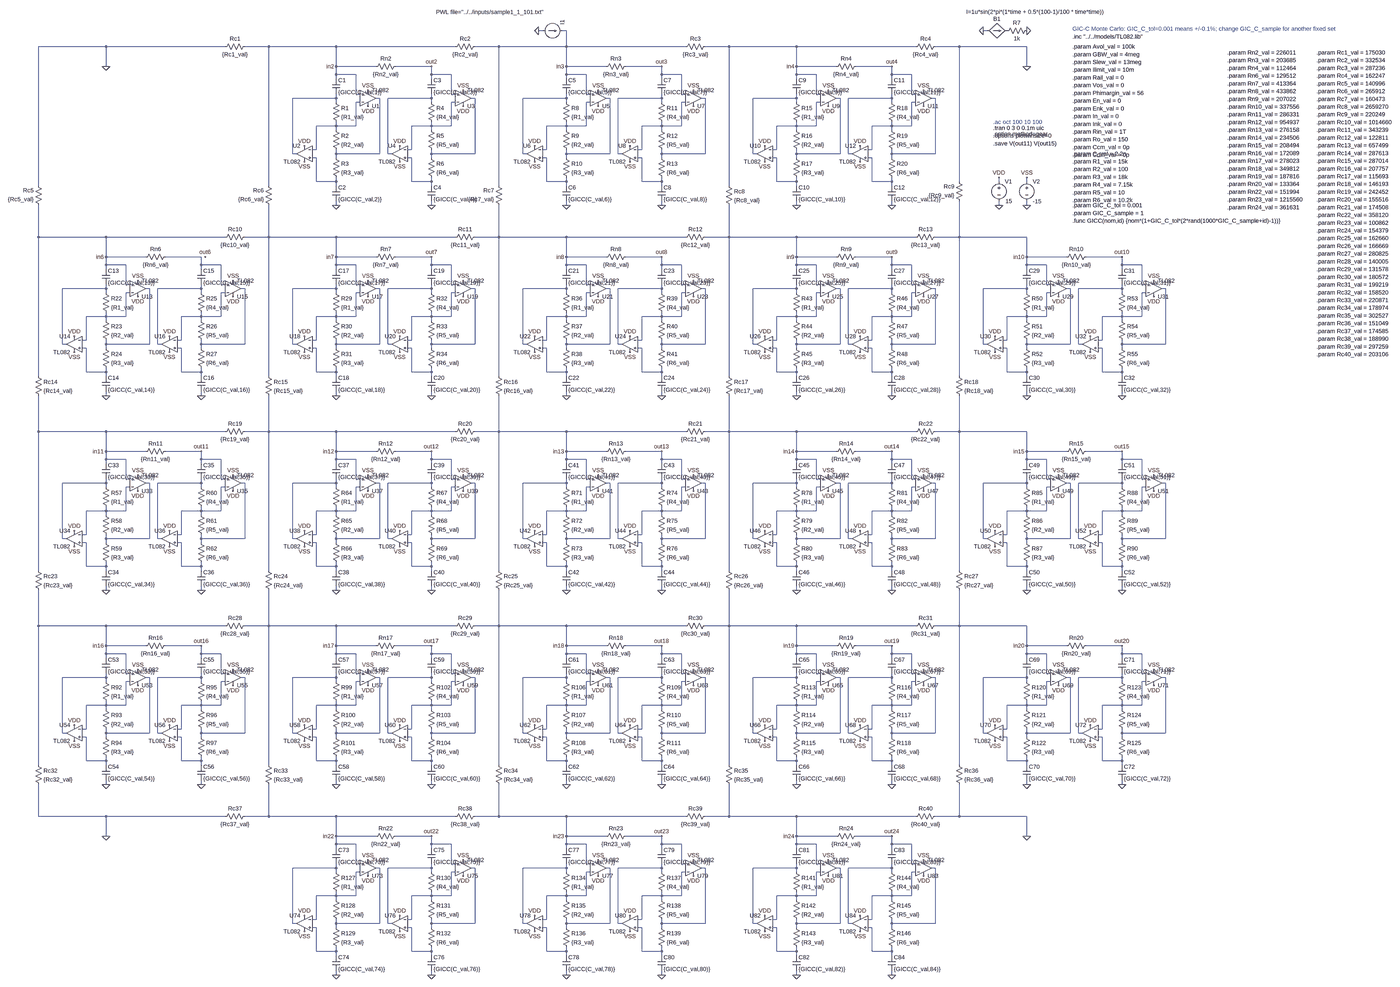
[diagram p0: schematic GIC_C.asc, whole sheet]
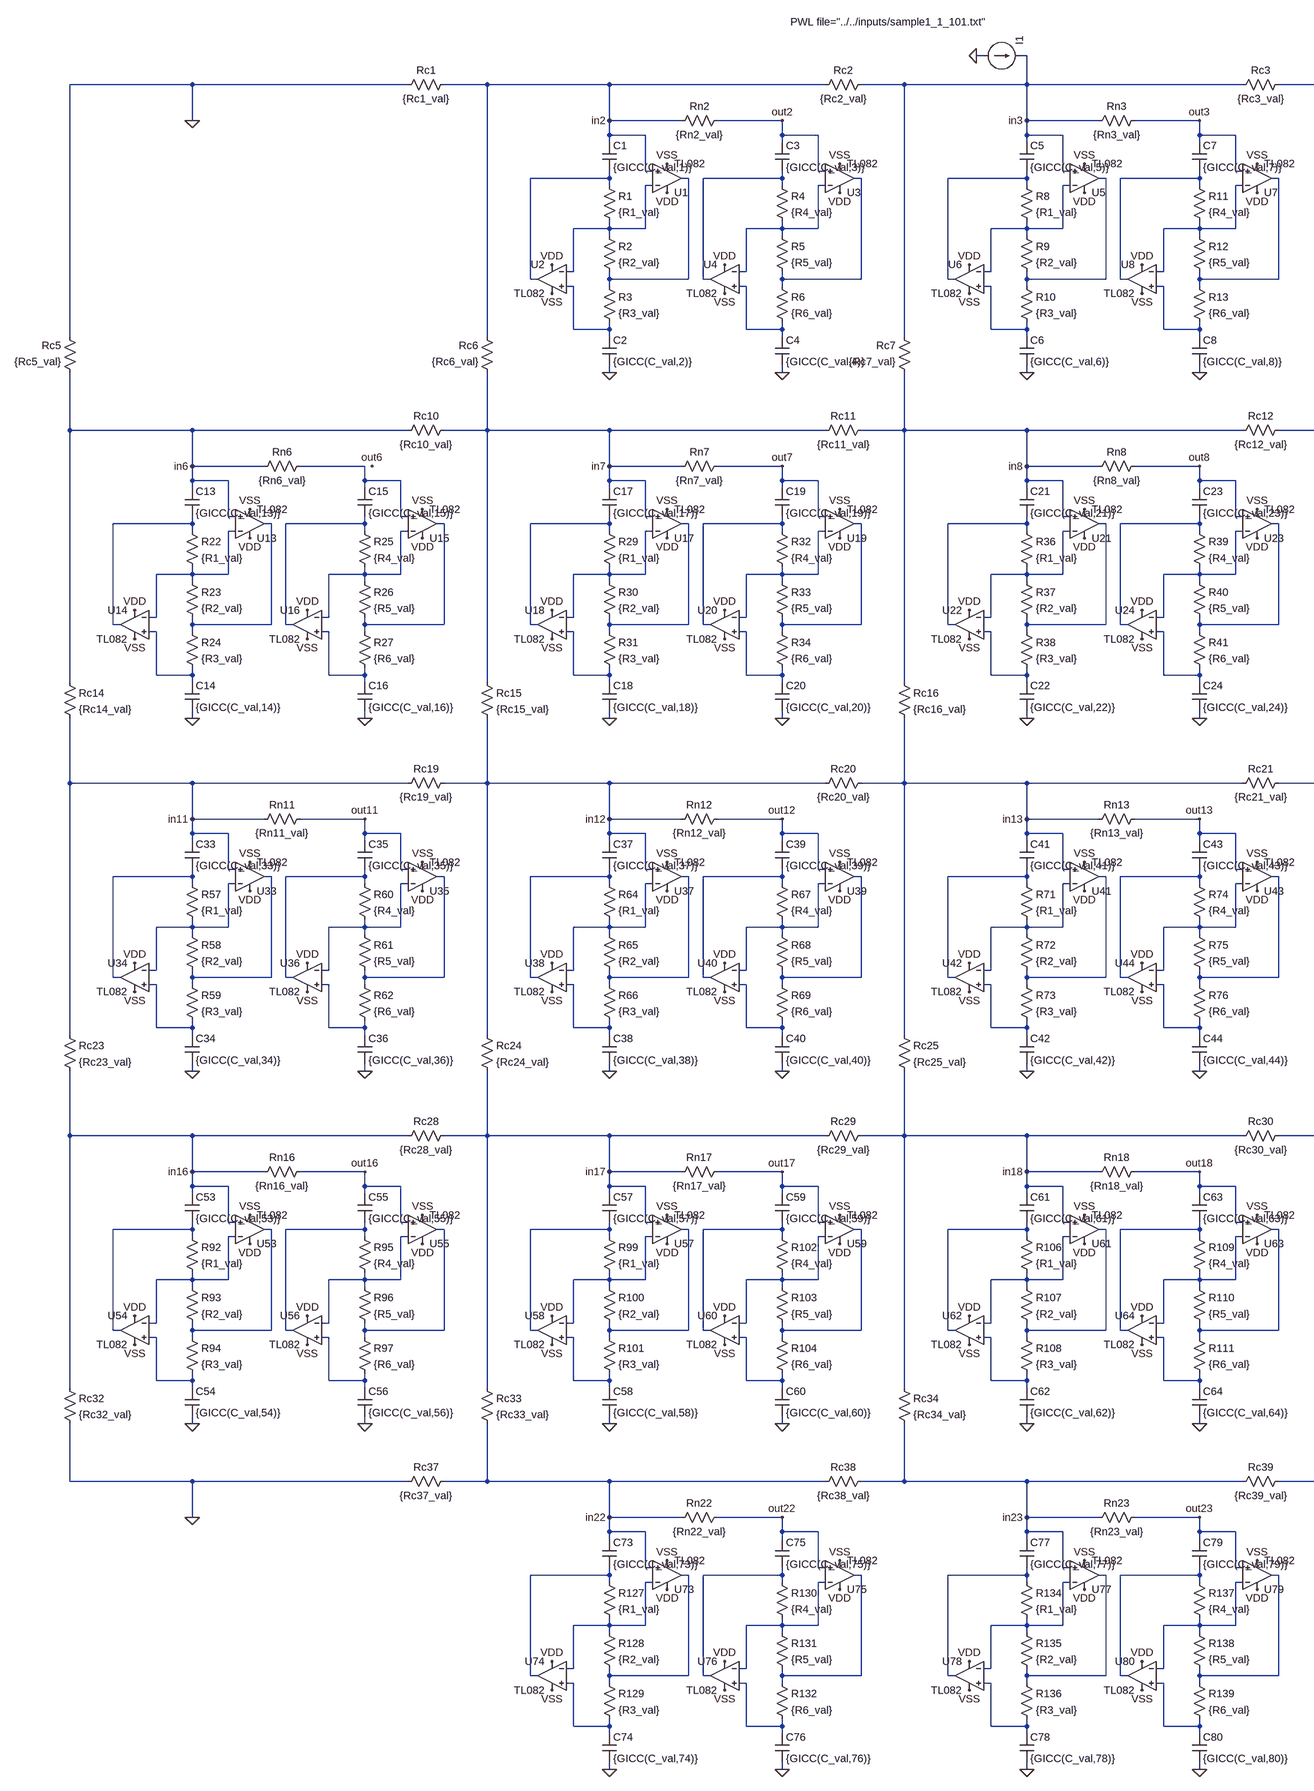
[diagram p1: schematic GIC_C.asc, part, row 1 of 1, column 1 of 2]
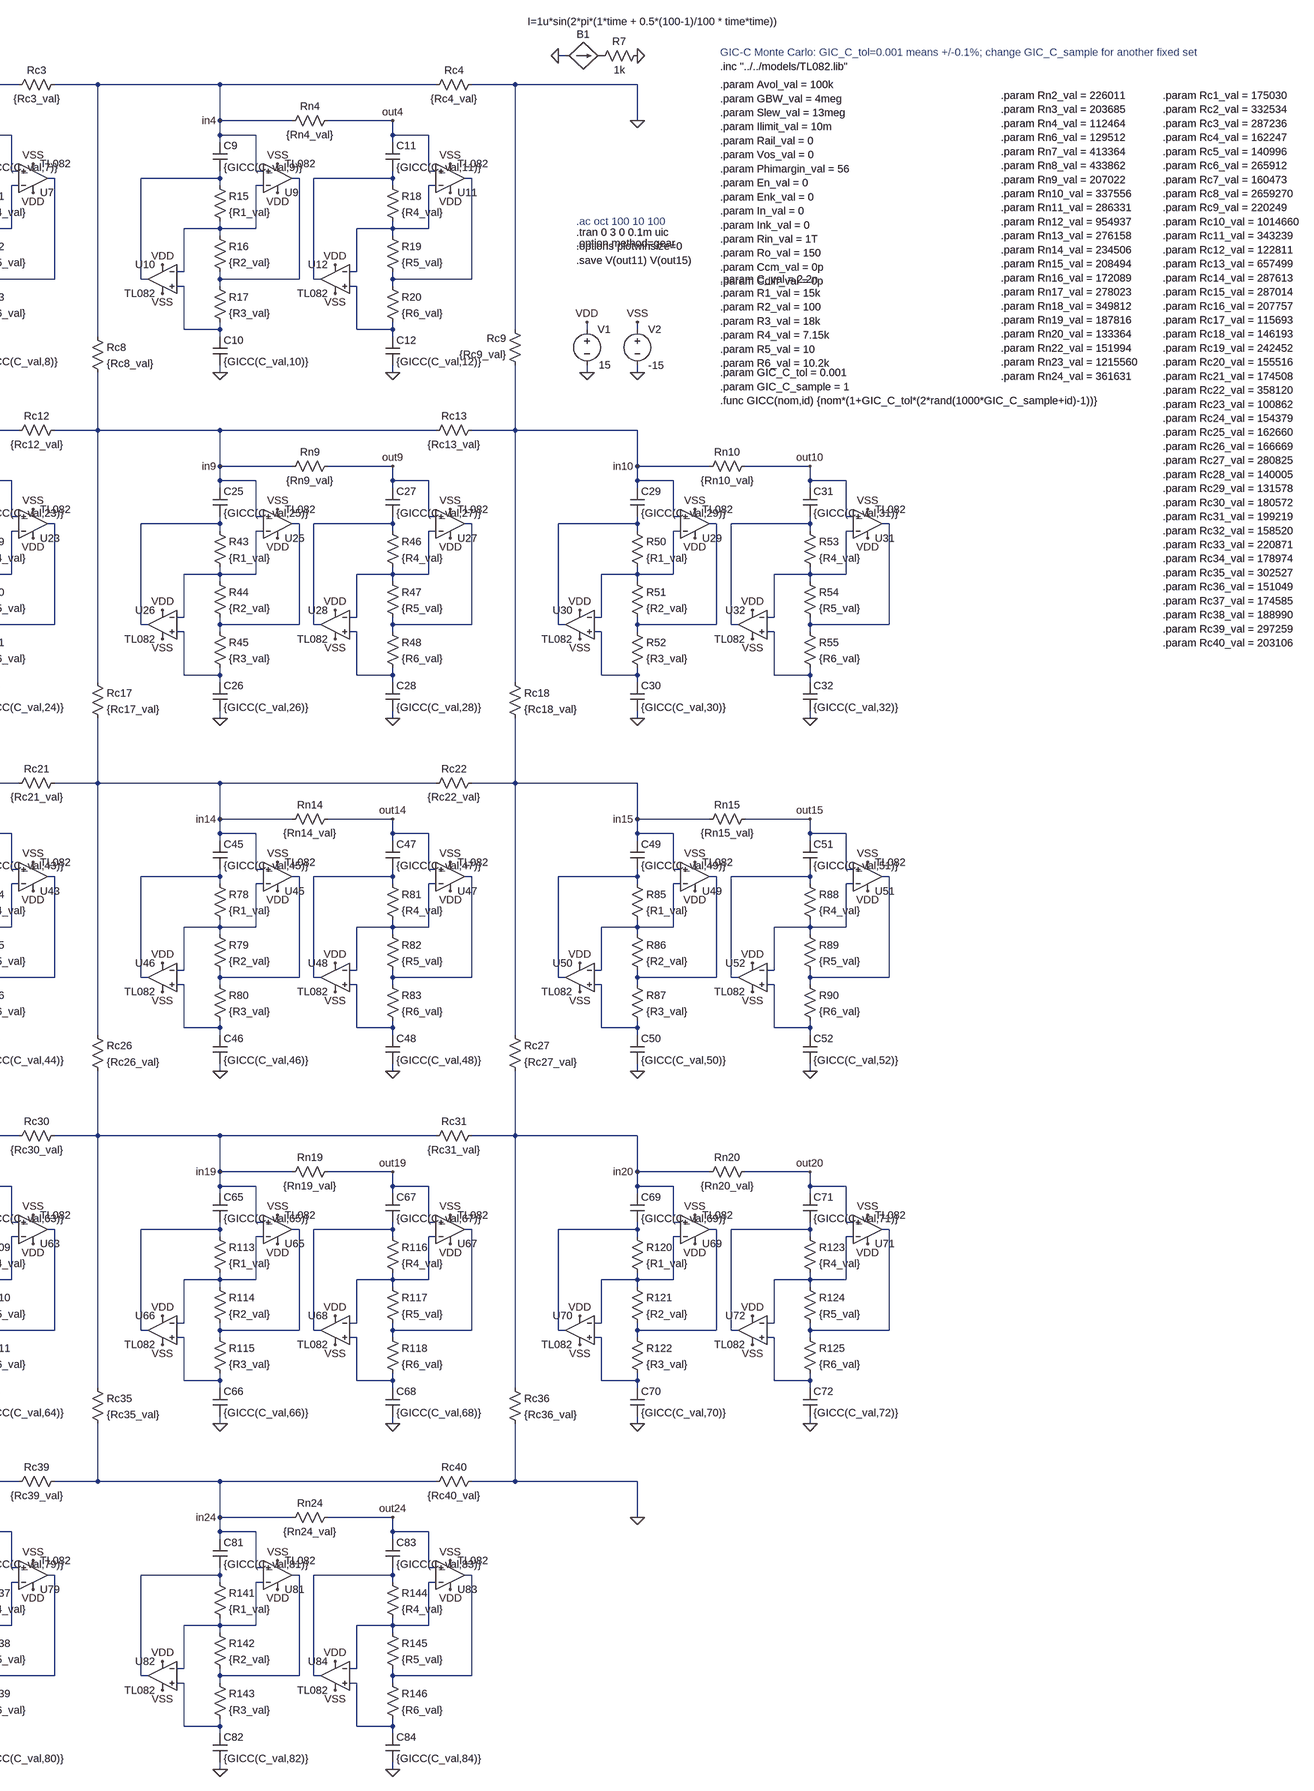
[diagram p2: schematic GIC_C.asc, part, row 1 of 1, column 2 of 2]
* GIC_C.asc
V1 VDD 0 15
V2 VSS 0 -15
C1 in2 N001 {GICC(C_val,1)}
R1 N001 N013 {R1_val}
R2 N013 N002 {R2_val}
R3 N002 N019 {R3_val}
C2 N019 0 {GICC(C_val,2)}
C3 out2 N003 {GICC(C_val,3)}
R4 N003 N014 {R4_val}
R5 N014 N004 {R5_val}
R6 N004 N020 {R6_val}
C4 N020 0 {GICC(C_val,4)}
Rn2 out2 in2 {Rn2_val}
C5 in3 N005 {GICC(C_val,5)}
R8 N005 N015 {R1_val}
R9 N015 N006 {R2_val}
R10 N006 N021 {R3_val}
C6 N021 0 {GICC(C_val,6)}
C7 out3 N007 {GICC(C_val,7)}
R11 N007 N016 {R4_val}
R12 N016 N008 {R5_val}
R13 N008 N022 {R6_val}
C8 N022 0 {GICC(C_val,8)}
Rn3 out3 in3 {Rn3_val}
C9 in4 N009 {GICC(C_val,9)}
R15 N009 N017 {R1_val}
R16 N017 N010 {R2_val}
R17 N010 N023 {R3_val}
C10 N023 0 {GICC(C_val,10)}
C11 out4 N011 {GICC(C_val,11)}
R18 N011 N018 {R4_val}
R19 N018 N012 {R5_val}
R20 N012 N024 {R6_val}
C12 N024 0 {GICC(C_val,12)}
Rn4 out4 in4 {Rn4_val}
C13 in6 N026 {GICC(C_val,13)}
R22 N026 N046 {R1_val}
R23 N046 N027 {R2_val}
R24 N027 N056 {R3_val}
C14 N056 0 {GICC(C_val,14)}
C15 N025 N028 {GICC(C_val,15)}
R25 N028 N047 {R4_val}
R26 N047 N029 {R5_val}
R27 N029 N057 {R6_val}
C16 N057 0 {GICC(C_val,16)}
Rn6 N025 in6 {Rn6_val}
C17 in7 N030 {GICC(C_val,17)}
R29 N030 N048 {R1_val}
R30 N048 N031 {R2_val}
R31 N031 N058 {R3_val}
C18 N058 0 {GICC(C_val,18)}
C19 out7 N032 {GICC(C_val,19)}
R32 N032 N049 {R4_val}
R33 N049 N033 {R5_val}
R34 N033 N059 {R6_val}
C20 N059 0 {GICC(C_val,20)}
Rn7 out7 in7 {Rn7_val}
C21 in8 N034 {GICC(C_val,21)}
R36 N034 N050 {R1_val}
R37 N050 N035 {R2_val}
R38 N035 N060 {R3_val}
C22 N060 0 {GICC(C_val,22)}
C23 out8 N036 {GICC(C_val,23)}
R39 N036 N051 {R4_val}
R40 N051 N037 {R5_val}
R41 N037 N061 {R6_val}
C24 N061 0 {GICC(C_val,24)}
Rn8 out8 in8 {Rn8_val}
C25 in9 N038 {GICC(C_val,25)}
R43 N038 N052 {R1_val}
R44 N052 N039 {R2_val}
R45 N039 N062 {R3_val}
C26 N062 0 {GICC(C_val,26)}
C27 out9 N040 {GICC(C_val,27)}
R46 N040 N053 {R4_val}
R47 N053 N041 {R5_val}
R48 N041 N063 {R6_val}
C28 N063 0 {GICC(C_val,28)}
Rn9 out9 in9 {Rn9_val}
C29 in10 N042 {GICC(C_val,29)}
R50 N042 N054 {R1_val}
R51 N054 N043 {R2_val}
R52 N043 N064 {R3_val}
C30 N064 0 {GICC(C_val,30)}
C31 out10 N044 {GICC(C_val,31)}
R53 N044 N055 {R4_val}
R54 N055 N045 {R5_val}
R55 N045 N065 {R6_val}
C32 N065 0 {GICC(C_val,32)}
Rn10 out10 in10 {Rn10_val}
C33 in11 N066 {GICC(C_val,33)}
R57 N066 N086 {R1_val}
R58 N086 N067 {R2_val}
R59 N067 N096 {R3_val}
C34 N096 0 {GICC(C_val,34)}
C35 out11 N068 {GICC(C_val,35)}
R60 N068 N087 {R4_val}
R61 N087 N069 {R5_val}
R62 N069 N097 {R6_val}
C36 N097 0 {GICC(C_val,36)}
Rn11 out11 in11 {Rn11_val}
C37 in12 N070 {GICC(C_val,37)}
R64 N070 N088 {R1_val}
R65 N088 N071 {R2_val}
R66 N071 N098 {R3_val}
C38 N098 0 {GICC(C_val,38)}
C39 out12 N072 {GICC(C_val,39)}
R67 N072 N089 {R4_val}
R68 N089 N073 {R5_val}
R69 N073 N099 {R6_val}
C40 N099 0 {GICC(C_val,40)}
Rn12 out12 in12 {Rn12_val}
C41 in13 N074 {GICC(C_val,41)}
R71 N074 N090 {R1_val}
R72 N090 N075 {R2_val}
R73 N075 N100 {R3_val}
C42 N100 0 {GICC(C_val,42)}
C43 out13 N076 {GICC(C_val,43)}
R74 N076 N091 {R4_val}
R75 N091 N077 {R5_val}
R76 N077 N101 {R6_val}
C44 N101 0 {GICC(C_val,44)}
Rn13 out13 in13 {Rn13_val}
C45 in14 N078 {GICC(C_val,45)}
R78 N078 N092 {R1_val}
R79 N092 N079 {R2_val}
R80 N079 N102 {R3_val}
C46 N102 0 {GICC(C_val,46)}
C47 out14 N080 {GICC(C_val,47)}
R81 N080 N093 {R4_val}
R82 N093 N081 {R5_val}
R83 N081 N103 {R6_val}
C48 N103 0 {GICC(C_val,48)}
Rn14 out14 in14 {Rn14_val}
C49 in15 N082 {GICC(C_val,49)}
R85 N082 N094 {R1_val}
R86 N094 N083 {R2_val}
R87 N083 N104 {R3_val}
C50 N104 0 {GICC(C_val,50)}
C51 out15 N084 {GICC(C_val,51)}
R88 N084 N095 {R4_val}
R89 N095 N085 {R5_val}
R90 N085 N105 {R6_val}
C52 N105 0 {GICC(C_val,52)}
Rn15 out15 in15 {Rn15_val}
C53 in16 N106 {GICC(C_val,53)}
R92 N106 N126 {R1_val}
R93 N126 N107 {R2_val}
R94 N107 N136 {R3_val}
C54 N136 0 {GICC(C_val,54)}
C55 out16 N108 {GICC(C_val,55)}
R95 N108 N127 {R4_val}
R96 N127 N109 {R5_val}
R97 N109 N137 {R6_val}
C56 N137 0 {GICC(C_val,56)}
Rn16 out16 in16 {Rn16_val}
C57 in17 N110 {GICC(C_val,57)}
R99 N110 N128 {R1_val}
R100 N128 N111 {R2_val}
R101 N111 N138 {R3_val}
C58 N138 0 {GICC(C_val,58)}
C59 out17 N112 {GICC(C_val,59)}
R102 N112 N129 {R4_val}
R103 N129 N113 {R5_val}
R104 N113 N139 {R6_val}
C60 N139 0 {GICC(C_val,60)}
Rn17 out17 in17 {Rn17_val}
C61 in18 N114 {GICC(C_val,61)}
R106 N114 N130 {R1_val}
R107 N130 N115 {R2_val}
R108 N115 N140 {R3_val}
C62 N140 0 {GICC(C_val,62)}
C63 out18 N116 {GICC(C_val,63)}
R109 N116 N131 {R4_val}
R110 N131 N117 {R5_val}
R111 N117 N141 {R6_val}
C64 N141 0 {GICC(C_val,64)}
Rn18 out18 in18 {Rn18_val}
C65 in19 N118 {GICC(C_val,65)}
R113 N118 N132 {R1_val}
R114 N132 N119 {R2_val}
R115 N119 N142 {R3_val}
C66 N142 0 {GICC(C_val,66)}
C67 out19 N120 {GICC(C_val,67)}
R116 N120 N133 {R4_val}
R117 N133 N121 {R5_val}
R118 N121 N143 {R6_val}
C68 N143 0 {GICC(C_val,68)}
Rn19 out19 in19 {Rn19_val}
C69 in20 N122 {GICC(C_val,69)}
R120 N122 N134 {R1_val}
R121 N134 N123 {R2_val}
R122 N123 N144 {R3_val}
C70 N144 0 {GICC(C_val,70)}
C71 out20 N124 {GICC(C_val,71)}
R123 N124 N135 {R4_val}
R124 N135 N125 {R5_val}
R125 N125 N145 {R6_val}
C72 N145 0 {GICC(C_val,72)}
Rn20 out20 in20 {Rn20_val}
C73 in22 N146 {GICC(C_val,73)}
R127 N146 N158 {R1_val}
R128 N158 N147 {R2_val}
R129 N147 N164 {R3_val}
C74 N164 0 {GICC(C_val,74)}
C75 out22 N148 {GICC(C_val,75)}
R130 N148 N159 {R4_val}
R131 N159 N149 {R5_val}
R132 N149 N165 {R6_val}
C76 N165 0 {GICC(C_val,76)}
Rn22 out22 in22 {Rn22_val}
C77 in23 N150 {GICC(C_val,77)}
R134 N150 N160 {R1_val}
R135 N160 N151 {R2_val}
R136 N151 N166 {R3_val}
C78 N166 0 {GICC(C_val,78)}
C79 out23 N152 {GICC(C_val,79)}
R137 N152 N161 {R4_val}
R138 N161 N153 {R5_val}
R139 N153 N167 {R6_val}
C80 N167 0 {GICC(C_val,80)}
Rn23 out23 in23 {Rn23_val}
C81 in24 N154 {GICC(C_val,81)}
R141 N154 N162 {R1_val}
R142 N162 N155 {R2_val}
R143 N155 N168 {R3_val}
C82 N168 0 {GICC(C_val,82)}
C83 out24 N156 {GICC(C_val,83)}
R144 N156 N163 {R4_val}
R145 N163 N157 {R5_val}
R146 N157 N169 {R6_val}
C84 N169 0 {GICC(C_val,84)}
Rn24 out24 in24 {Rn24_val}
Rc2 in3 in2 {Rc2_val}
Rc3 in4 in3 {Rc3_val}
Rc6 in7 in2 {Rc6_val}
Rc7 in8 in3 {Rc7_val}
Rc11 in7 in8 {Rc11_val}
Rc12 in8 in9 {Rc12_val}
Rc13 in9 in10 {Rc13_val}
Rc14 in6 in11 {Rc14_val}
Rc15 in7 in12 {Rc15_val}
Rc16 in8 in13 {Rc16_val}
Rc18 in10 in15 {Rc18_val}
Rc21 in14 in13 {Rc21_val}
Rc22 in15 in14 {Rc22_val}
Rc23 in11 in16 {Rc23_val}
Rc24 in12 in17 {Rc24_val}
Rc25 in13 in18 {Rc25_val}
Rc26 in14 in19 {Rc26_val}
Rc27 in15 in20 {Rc27_val}
Rc28 in17 in16 {Rc28_val}
Rc30 in19 in18 {Rc30_val}
Rc32 in16 0 {Rc32_val}
Rc33 in17 in22 {Rc33_val}
Rc34 in18 in23 {Rc34_val}
Rc35 in19 in24 {Rc35_val}
Rc36 in20 0 {Rc36_val}
Rc1 in2 0 {Rc1_val}
Rc5 in6 0 {Rc5_val}
Rc9 in10 0 {Rc9_val}
Rc4 in4 0 {Rc4_val}
Rc37 in22 0 {Rc37_val}
Rc38 in23 in22 {Rc38_val}
Rc39 in24 in23 {Rc39_val}
Rc40 0 in24 {Rc40_val}
R7 0 P001 1k
B1 0 P001 I=1u*sin(2*pi*(1*time + 0.5*(100-1)/100 * time*time))
I1 0 in3 PWL file="../../inputs/sample1_1_101.txt"
X§U1 in2 N013 VDD VSS N002 TL082  ; pins In+ In- V+ V- OUT
X§U2 N019 N013 VDD VSS N001 TL082  ; pins In+ In- V+ V- OUT
X§U3 out2 N014 VDD VSS N004 TL082  ; pins In+ In- V+ V- OUT
X§U4 N020 N014 VDD VSS N003 TL082  ; pins In+ In- V+ V- OUT
X§U5 in3 N015 VDD VSS N006 TL082  ; pins In+ In- V+ V- OUT
X§U6 N021 N015 VDD VSS N005 TL082  ; pins In+ In- V+ V- OUT
X§U7 out3 N016 VDD VSS N008 TL082  ; pins In+ In- V+ V- OUT
X§U8 N022 N016 VDD VSS N007 TL082  ; pins In+ In- V+ V- OUT
X§U9 in4 N017 VDD VSS N010 TL082  ; pins In+ In- V+ V- OUT
X§U10 N023 N017 VDD VSS N009 TL082  ; pins In+ In- V+ V- OUT
X§U11 out4 N018 VDD VSS N012 TL082  ; pins In+ In- V+ V- OUT
X§U12 N024 N018 VDD VSS N011 TL082  ; pins In+ In- V+ V- OUT
X§U13 in6 N046 VDD VSS N027 TL082  ; pins In+ In- V+ V- OUT
X§U14 N056 N046 VDD VSS N026 TL082  ; pins In+ In- V+ V- OUT
X§U15 N025 N047 VDD VSS N029 TL082  ; pins In+ In- V+ V- OUT
X§U16 N057 N047 VDD VSS N028 TL082  ; pins In+ In- V+ V- OUT
X§U17 in7 N048 VDD VSS N031 TL082  ; pins In+ In- V+ V- OUT
X§U18 N058 N048 VDD VSS N030 TL082  ; pins In+ In- V+ V- OUT
X§U19 out7 N049 VDD VSS N033 TL082  ; pins In+ In- V+ V- OUT
X§U20 N059 N049 VDD VSS N032 TL082  ; pins In+ In- V+ V- OUT
X§U21 in8 N050 VDD VSS N035 TL082  ; pins In+ In- V+ V- OUT
X§U22 N060 N050 VDD VSS N034 TL082  ; pins In+ In- V+ V- OUT
X§U23 out8 N051 VDD VSS N037 TL082  ; pins In+ In- V+ V- OUT
X§U24 N061 N051 VDD VSS N036 TL082  ; pins In+ In- V+ V- OUT
X§U25 in9 N052 VDD VSS N039 TL082  ; pins In+ In- V+ V- OUT
X§U26 N062 N052 VDD VSS N038 TL082  ; pins In+ In- V+ V- OUT
X§U27 out9 N053 VDD VSS N041 TL082  ; pins In+ In- V+ V- OUT
X§U28 N063 N053 VDD VSS N040 TL082  ; pins In+ In- V+ V- OUT
X§U29 in10 N054 VDD VSS N043 TL082  ; pins In+ In- V+ V- OUT
X§U30 N064 N054 VDD VSS N042 TL082  ; pins In+ In- V+ V- OUT
X§U31 out10 N055 VDD VSS N045 TL082  ; pins In+ In- V+ V- OUT
X§U32 N065 N055 VDD VSS N044 TL082  ; pins In+ In- V+ V- OUT
X§U33 in11 N086 VDD VSS N067 TL082  ; pins In+ In- V+ V- OUT
X§U34 N096 N086 VDD VSS N066 TL082  ; pins In+ In- V+ V- OUT
X§U35 out11 N087 VDD VSS N069 TL082  ; pins In+ In- V+ V- OUT
X§U36 N097 N087 VDD VSS N068 TL082  ; pins In+ In- V+ V- OUT
X§U37 in12 N088 VDD VSS N071 TL082  ; pins In+ In- V+ V- OUT
X§U38 N098 N088 VDD VSS N070 TL082  ; pins In+ In- V+ V- OUT
X§U39 out12 N089 VDD VSS N073 TL082  ; pins In+ In- V+ V- OUT
X§U40 N099 N089 VDD VSS N072 TL082  ; pins In+ In- V+ V- OUT
X§U41 in13 N090 VDD VSS N075 TL082  ; pins In+ In- V+ V- OUT
X§U42 N100 N090 VDD VSS N074 TL082  ; pins In+ In- V+ V- OUT
X§U43 out13 N091 VDD VSS N077 TL082  ; pins In+ In- V+ V- OUT
X§U44 N101 N091 VDD VSS N076 TL082  ; pins In+ In- V+ V- OUT
X§U45 in14 N092 VDD VSS N079 TL082  ; pins In+ In- V+ V- OUT
X§U46 N102 N092 VDD VSS N078 TL082  ; pins In+ In- V+ V- OUT
X§U47 out14 N093 VDD VSS N081 TL082  ; pins In+ In- V+ V- OUT
X§U48 N103 N093 VDD VSS N080 TL082  ; pins In+ In- V+ V- OUT
X§U49 in15 N094 VDD VSS N083 TL082  ; pins In+ In- V+ V- OUT
X§U50 N104 N094 VDD VSS N082 TL082  ; pins In+ In- V+ V- OUT
X§U51 out15 N095 VDD VSS N085 TL082  ; pins In+ In- V+ V- OUT
X§U52 N105 N095 VDD VSS N084 TL082  ; pins In+ In- V+ V- OUT
X§U53 in16 N126 VDD VSS N107 TL082  ; pins In+ In- V+ V- OUT
X§U54 N136 N126 VDD VSS N106 TL082  ; pins In+ In- V+ V- OUT
X§U55 out16 N127 VDD VSS N109 TL082  ; pins In+ In- V+ V- OUT
X§U56 N137 N127 VDD VSS N108 TL082  ; pins In+ In- V+ V- OUT
X§U57 in17 N128 VDD VSS N111 TL082  ; pins In+ In- V+ V- OUT
X§U58 N138 N128 VDD VSS N110 TL082  ; pins In+ In- V+ V- OUT
X§U59 out17 N129 VDD VSS N113 TL082  ; pins In+ In- V+ V- OUT
X§U60 N139 N129 VDD VSS N112 TL082  ; pins In+ In- V+ V- OUT
X§U61 in18 N130 VDD VSS N115 TL082  ; pins In+ In- V+ V- OUT
X§U62 N140 N130 VDD VSS N114 TL082  ; pins In+ In- V+ V- OUT
X§U63 out18 N131 VDD VSS N117 TL082  ; pins In+ In- V+ V- OUT
X§U64 N141 N131 VDD VSS N116 TL082  ; pins In+ In- V+ V- OUT
X§U65 in19 N132 VDD VSS N119 TL082  ; pins In+ In- V+ V- OUT
X§U66 N142 N132 VDD VSS N118 TL082  ; pins In+ In- V+ V- OUT
X§U67 out19 N133 VDD VSS N121 TL082  ; pins In+ In- V+ V- OUT
X§U68 N143 N133 VDD VSS N120 TL082  ; pins In+ In- V+ V- OUT
X§U69 in20 N134 VDD VSS N123 TL082  ; pins In+ In- V+ V- OUT
X§U70 N144 N134 VDD VSS N122 TL082  ; pins In+ In- V+ V- OUT
X§U71 out20 N135 VDD VSS N125 TL082  ; pins In+ In- V+ V- OUT
X§U72 N145 N135 VDD VSS N124 TL082  ; pins In+ In- V+ V- OUT
X§U73 in22 N158 VDD VSS N147 TL082  ; pins In+ In- V+ V- OUT
X§U74 N164 N158 VDD VSS N146 TL082  ; pins In+ In- V+ V- OUT
X§U75 out22 N159 VDD VSS N149 TL082  ; pins In+ In- V+ V- OUT
X§U76 N165 N159 VDD VSS N148 TL082  ; pins In+ In- V+ V- OUT
X§U77 in23 N160 VDD VSS N151 TL082  ; pins In+ In- V+ V- OUT
X§U78 N166 N160 VDD VSS N150 TL082  ; pins In+ In- V+ V- OUT
X§U79 out23 N161 VDD VSS N153 TL082  ; pins In+ In- V+ V- OUT
X§U80 N167 N161 VDD VSS N152 TL082  ; pins In+ In- V+ V- OUT
X§U81 in24 N162 VDD VSS N155 TL082  ; pins In+ In- V+ V- OUT
X§U82 N168 N162 VDD VSS N154 TL082  ; pins In+ In- V+ V- OUT
X§U83 out24 N163 VDD VSS N157 TL082  ; pins In+ In- V+ V- OUT
X§U84 N169 N163 VDD VSS N156 TL082  ; pins In+ In- V+ V- OUT
Rc8 in4 in9 {Rc8_val}
Rc10 in7 in6 {Rc10_val}
Rc17 in9 in14 {Rc17_val}
Rc19 in12 in11 {Rc19_val}
Rc20 in13 in12 {Rc20_val}
Rc29 in18 in17 {Rc29_val}
Rc31 in20 in19 {Rc31_val}
* .ac oct 100 10 100
.tran 0 3 0 0.1m uic
.options plotwinsize=0
.save V(out11) V(out15)
.option method=gear
* GIC-C Monte Carlo: GIC_C_tol=0.001 means +/-0.1%; change GIC_C_sample for another fixed set
.inc "../../models/TL082.lib"
.param Avol_val = 100k
.param GBW_val = 4meg
.param Slew_val = 13meg
.param Ilimit_val = 10m
.param Rail_val = 0
.param Vos_val = 0
.param Phimargin_val = 56
.param En_val = 0
.param Enk_val = 0
.param In_val = 0
.param Ink_val = 0
.param Rin_val = 1T
.param Ro_val = 150
.param Ccm_val = 0p
.param Cdiff_val = 0p
.param C_val = 2.2n
.param R1_val = 15k
.param R2_val = 100
.param R3_val = 18k
.param R4_val = 7.15k
.param R5_val = 10
.param R6_val = 10.2k
.param Rc1_val = 175030
.param Rc2_val = 332534
.param Rc3_val = 287236
.param Rc4_val = 162247
.param Rc5_val = 140996
.param Rc6_val = 265912
.param Rc7_val = 160473
.param Rc8_val = 2659270
.param Rc9_val = 220249
.param Rc10_val = 1014660
.param Rc11_val = 343239
.param Rc12_val = 122811
.param Rc13_val = 657499
.param Rc14_val = 287613
.param Rc15_val = 287014
.param Rc16_val = 207757
.param Rc17_val = 115693
.param Rc18_val = 146193
.param Rc19_val = 242452
.param Rc20_val = 155516
.param Rc21_val = 174508
.param Rc22_val = 358120
.param Rc23_val = 100862
.param Rc24_val = 154379
.param Rc25_val = 162660
.param Rc26_val = 166669
.param Rc27_val = 280825
.param Rc28_val = 140005
.param Rc29_val = 131578
.param Rc30_val = 180572
.param Rc31_val = 199219
.param Rc32_val = 158520
.param Rc33_val = 220871
.param Rc34_val = 178974
.param Rc35_val = 302527
.param Rc36_val = 151049
.param Rc37_val = 174585
.param Rc38_val = 188990
.param Rc39_val = 297259
.param Rc40_val = 203106
.param Rn2_val = 226011
.param Rn3_val = 203685
.param Rn4_val = 112464
.param Rn6_val = 129512
.param Rn7_val = 413364
.param Rn8_val = 433862
.param Rn9_val = 207022
.param Rn10_val = 337556
.param Rn11_val = 286331
.param Rn12_val = 954937
.param Rn13_val = 276158
.param Rn14_val = 234506
.param Rn15_val = 208494
.param Rn16_val = 172089
.param Rn17_val = 278023
.param Rn18_val = 349812
.param Rn19_val = 187816
.param Rn20_val = 133364
.param Rn22_val = 151994
.param Rn23_val = 1215560
.param Rn24_val = 361631
.param GIC_C_tol = 0.001
.param GIC_C_sample = 1
.func GICC(nom,id) {nom*(1+GIC_C_tol*(2*rand(1000*GIC_C_sample+id)-1))}
.backanno
.end